# EAGLE schematic beads_v51 (EAGLE 9.0.1)

## Sheet 1 of 8
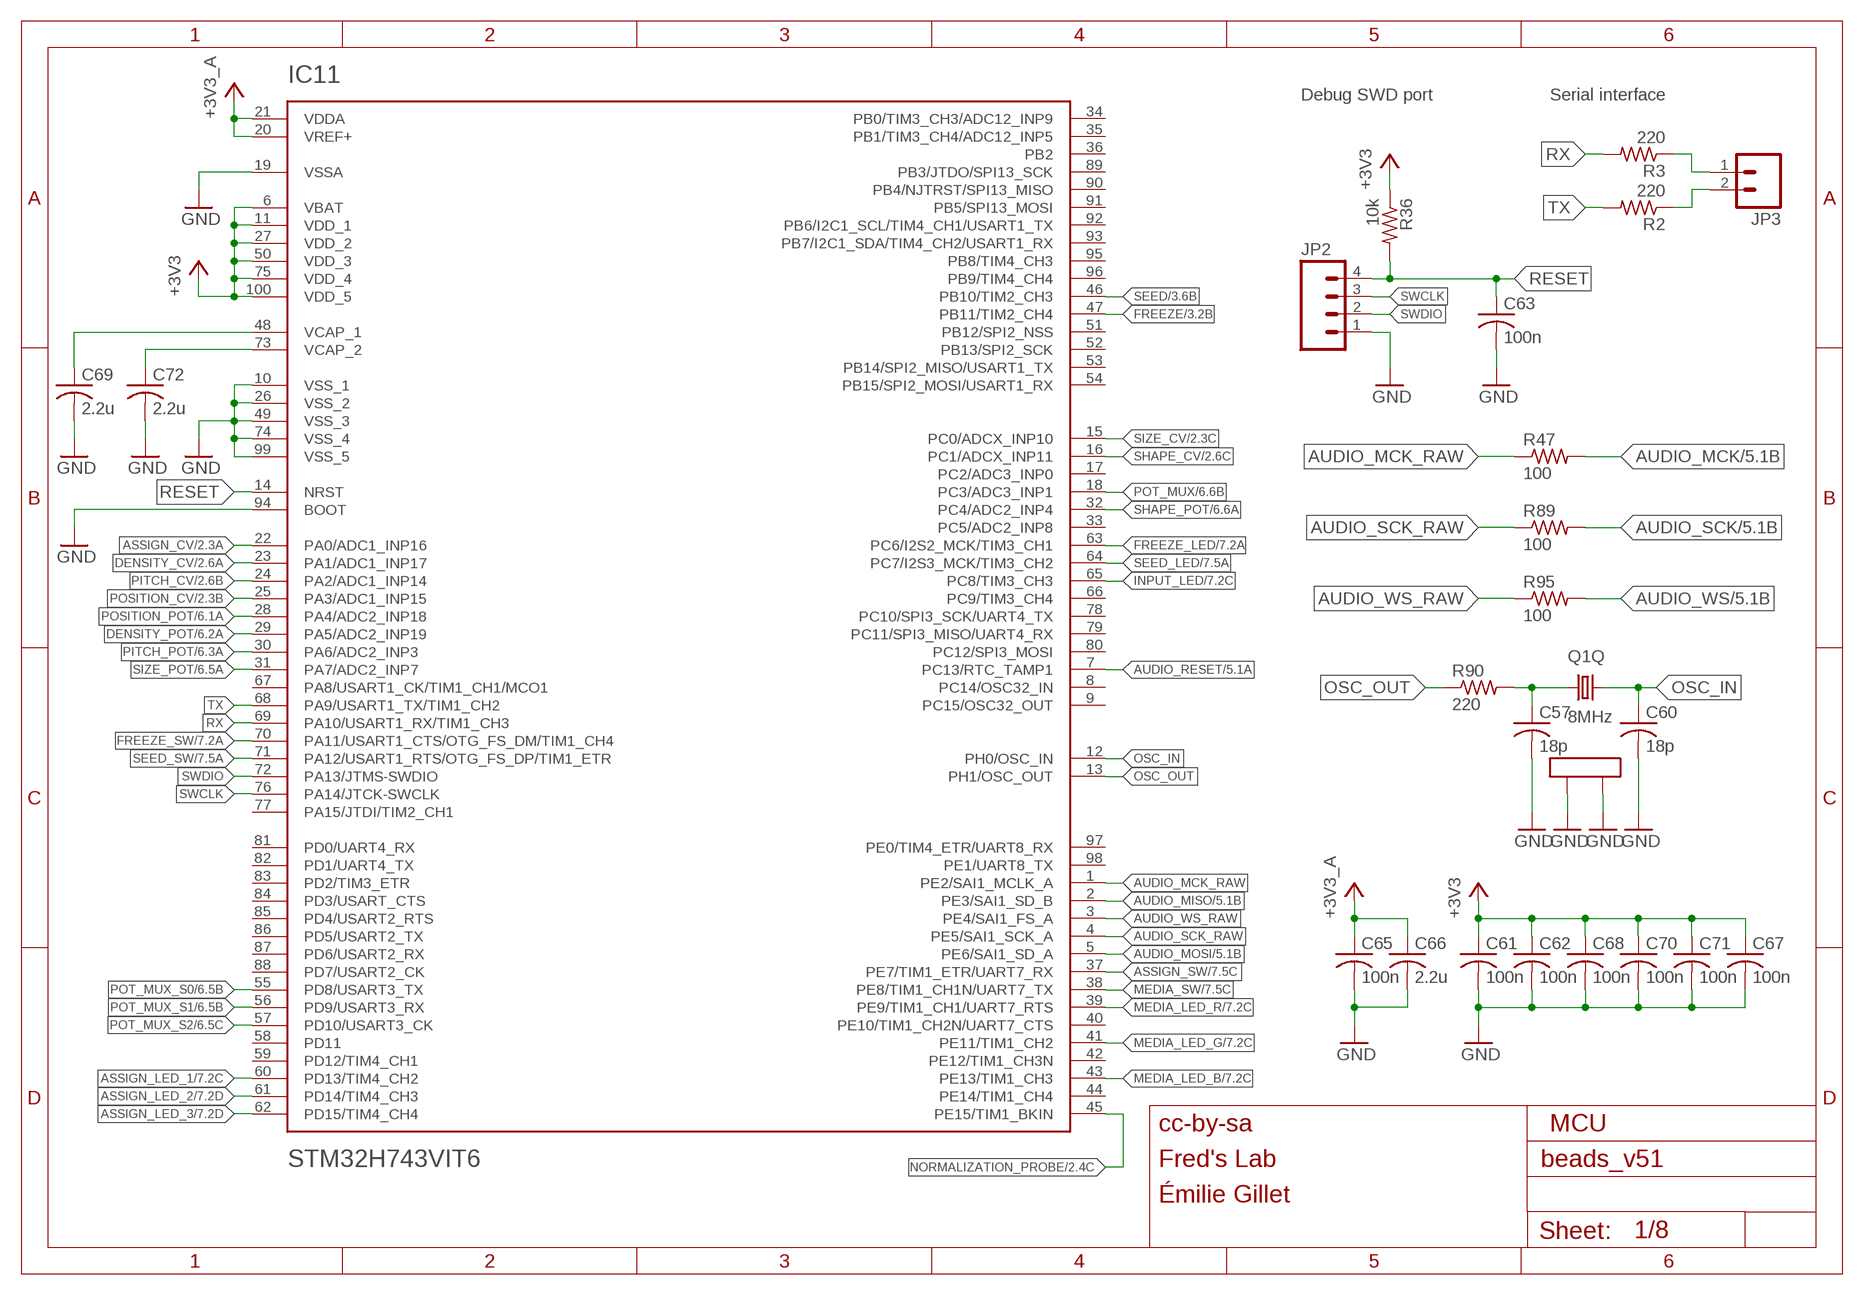
[diagram p0: schematic, sheet 1]

### Parts
C57  18p  C-USC0402  [C0402]
C60  18p  C-USC0402  [C0402]
C61  100n  C-USC0402  [C0402]
C62  100n  C-USC0402  [C0402]
C63  100n  C-USC0402  [C0402]
C65  100n  C-USC0402  [C0402]
C66  2.2u  C-USC0402  [C0402]
C67  100n  C-USC0402  [C0402]
C68  100n  C-USC0402  [C0402]
C69  2.2u  C-USC0402  [C0402]
C70  100n  C-USC0402  [C0402]
C71  100n  C-USC0402  [C0402]
C72  2.2u  C-USC0402  [C0402]
IC11  STM32H743VIT6  STM32H74X  [TQFP100]
JP2  M04PTH  [1X04]
JP3  M02PTH  [1X02]
Q1  8MHz  CRYSTAL  [CTS406]
R2  220  R-US_R0402  [R0402]
R3  220  R-US_R0402  [R0402]
R36  10k  R-US_R0402  [R0402]
R47  100  R-US_R0402  [R0402]
R89  100  R-US_R0402  [R0402]
R90  220  R-US_R0402  [R0402]
R95  100  R-US_R0402  [R0402]

### Nets
+3V3: C61.1 C62.1 C67.1 C68.1 C70.1 C71.1 IC11.6(VBAT) IC11.11(VDD_1) IC11.27(VDD_2) IC11.50(VDD_3) IC11.75(VDD_4) IC11.100(VDD_5) R36.1 ; also sheet 2,7,8
+3V3_A: C65.1 C66.1 IC11.20(VREF+) IC11.21(VDDA) ; also sheet 2,3,5,6,8
ASSIGN_CV: IC11.22(PA0/ADC1_INP16) ; also sheet 2
ASSIGN_LED_1: IC11.60(PD13/TIM4_CH2) ; also sheet 7
ASSIGN_LED_2: IC11.61(PD14/TIM4_CH3) ; also sheet 7
ASSIGN_LED_3: IC11.62(PD15/TIM4_CH4) ; also sheet 7
ASSIGN_SW: IC11.37(PE7/TIM1_ETR/UART7_RX) ; also sheet 7
AUDIO_MCK: R47.2 ; also sheet 5
AUDIO_MCK_RAW: IC11.1(PE2/SAI1_MCLK_A) R47.1
AUDIO_MISO: IC11.2(PE3/SAI1_SD_B) ; also sheet 5
AUDIO_MOSI: IC11.5(PE6/SAI1_SD_A) ; also sheet 5
AUDIO_RESET: IC11.7(PC13/RTC_TAMP1) ; also sheet 5
AUDIO_SCK: R89.2 ; also sheet 5
AUDIO_SCK_RAW: IC11.4(PE5/SAI1_SCK_A) R89.1
AUDIO_WS: R95.2 ; also sheet 5
AUDIO_WS_RAW: IC11.3(PE4/SAI1_FS_A) R95.1
DENSITY_CV: IC11.23(PA1/ADC1_INP17) ; also sheet 2
DENSITY_POT: IC11.29(PA5/ADC2_INP19) ; also sheet 6
FREEZE: IC11.47(PB11/TIM2_CH4) ; also sheet 3
FREEZE_LED: IC11.63(PC6/I2S2_MCK/TIM3_CH1) ; also sheet 7
FREEZE_SW: IC11.70(PA11/USART1_CTS/OTG_FS_DM/TIM1_CH4) ; also sheet 7
GND: C57.2 C60.2 C61.2 C62.2 C63.2 C65.2 C66.2 C67.2 C68.2 C69.2 C70.2 C71.2 C72.2 IC11.10(VSS_1) IC11.19(VSSA) IC11.26(VSS_2) IC11.49(VSS_3) IC11.74(VSS_4) IC11.94(BOOT) IC11.99(VSS_5) JP2.1 Q1.2(LID1) Q1.4(LID2) ; also sheet 2,3,4,5,6,7,8
INPUT_LED: IC11.65(PC8/TIM3_CH3) ; also sheet 7
MEDIA_LED_B: IC11.43(PE13/TIM1_CH3) ; also sheet 7
MEDIA_LED_G: IC11.41(PE11/TIM1_CH2) ; also sheet 7
MEDIA_LED_R: IC11.39(PE9/TIM1_CH1/UART7_RTS) ; also sheet 7
MEDIA_SW: IC11.38(PE8/TIM1_CH1N/UART7_TX) ; also sheet 7
N$4: C57.1 Q1.1 R90.2
N$5: JP3.2 R2.1
N$6: JP3.1 R3.1
NORMALIZATION_PROBE: IC11.45(PE15/TIM1_BKIN) ; also sheet 2,3,4
OSC_IN: C60.1 IC11.12(PH0/OSC_IN) Q1.3
OSC_OUT: IC11.13(PH1/OSC_OUT) R90.1
PITCH_CV: IC11.24(PA2/ADC1_INP14) ; also sheet 2
PITCH_POT: IC11.30(PA6/ADC2_INP3) ; also sheet 6
POSITION_CV: IC11.25(PA3/ADC1_INP15) ; also sheet 2
POSITION_POT: IC11.28(PA4/ADC2_INP18) ; also sheet 6
POT_MUX: IC11.18(PC3/ADC3_INP1) ; also sheet 6
POT_MUX_S0: IC11.55(PD8/USART3_TX) ; also sheet 6
POT_MUX_S1: IC11.56(PD9/USART3_RX) ; also sheet 6
POT_MUX_S2: IC11.57(PD10/USART3_CK) ; also sheet 6
RESET: C63.1 IC11.14(NRST) JP2.4 R36.2
RX: IC11.69(PA10/USART1_RX/TIM1_CH3) R3.2
SEED: IC11.46(PB10/TIM2_CH3) ; also sheet 3
SEED_LED: IC11.64(PC7/I2S3_MCK/TIM3_CH2) ; also sheet 7
SEED_SW: IC11.71(PA12/USART1_RTS/OTG_FS_DP/TIM1_ETR) ; also sheet 7
SHAPE_CV: IC11.16(PC1/ADCX_INP11) ; also sheet 2
SHAPE_POT: IC11.32(PC4/ADC2_INP4) ; also sheet 6
SIZE_CV: IC11.15(PC0/ADCX_INP10) ; also sheet 2
SIZE_POT: IC11.31(PA7/ADC2_INP7) ; also sheet 6
SWCLK: IC11.76(PA14/JTCK-SWCLK) JP2.3
SWDIO: IC11.72(PA13/JTMS-SWDIO) JP2.2
TX: IC11.68(PA9/USART1_TX/TIM1_CH2) R2.2
VCAP_1: C69.1 IC11.48(VCAP_1)
VCAP_2: C72.1 IC11.73(VCAP_2)
Unconnected: IC11.8(PC14/OSC32_IN) IC11.9(PC15/OSC32_OUT) IC11.17(PC2/ADC3_INP0) IC11.33(PC5/ADC2_INP8) IC11.34(PB0/TIM3_CH3/ADC12_INP9) IC11.35(PB1/TIM3_CH4/ADC12_INP5) IC11.36(PB2) IC11.40(PE10/TIM1_CH2N/UART7_CTS) IC11.42(PE12/TIM1_CH3N) IC11.44(PE14/TIM1_CH4) IC11.51(PB12/SPI2_NSS) IC11.52(PB13/SPI2_SCK) IC11.53(PB14/SPI2_MISO/USART1_TX) IC11.54(PB15/SPI2_MOSI/USART1_RX) IC11.58(PD11) IC11.59(PD12/TIM4_CH1) IC11.66(PC9/TIM3_CH4) IC11.67(PA8/USART1_CK/TIM1_CH1/MCO1) IC11.77(PA15/JTDI/TIM2_CH1) IC11.78(PC10/SPI3_SCK/UART4_TX) IC11.79(PC11/SPI3_MISO/UART4_RX) IC11.80(PC12/SPI3_MOSI) IC11.81(PD0/UART4_RX) IC11.82(PD1/UART4_TX) IC11.83(PD2/TIM3_ETR) IC11.84(PD3/USART_CTS) IC11.85(PD4/USART2_RTS) IC11.86(PD5/USART2_TX) IC11.87(PD6/USART2_RX) IC11.88(PD7/USART2_CK) IC11.89(PB3/JTDO/SPI13_SCK) IC11.90(PB4/NJTRST/SPI13_MISO) IC11.91(PB5/SPI13_MOSI) IC11.92(PB6/I2C1_SCL/TIM4_CH1/USART1_TX) IC11.93(PB7/I2C1_SDA/TIM4_CH2/USART1_RX) IC11.95(PB8/TIM4_CH3) IC11.96(PB9/TIM4_CH4) IC11.97(PE0/TIM4_ETR/UART8_RX) IC11.98(PE1/UART8_TX)

### Notes on the sheet
- Debug SWD port | Serial interface
- cc-by-sa | MCU
- Fred's Lab
- Émilie Gillet

## Sheet 2 of 8
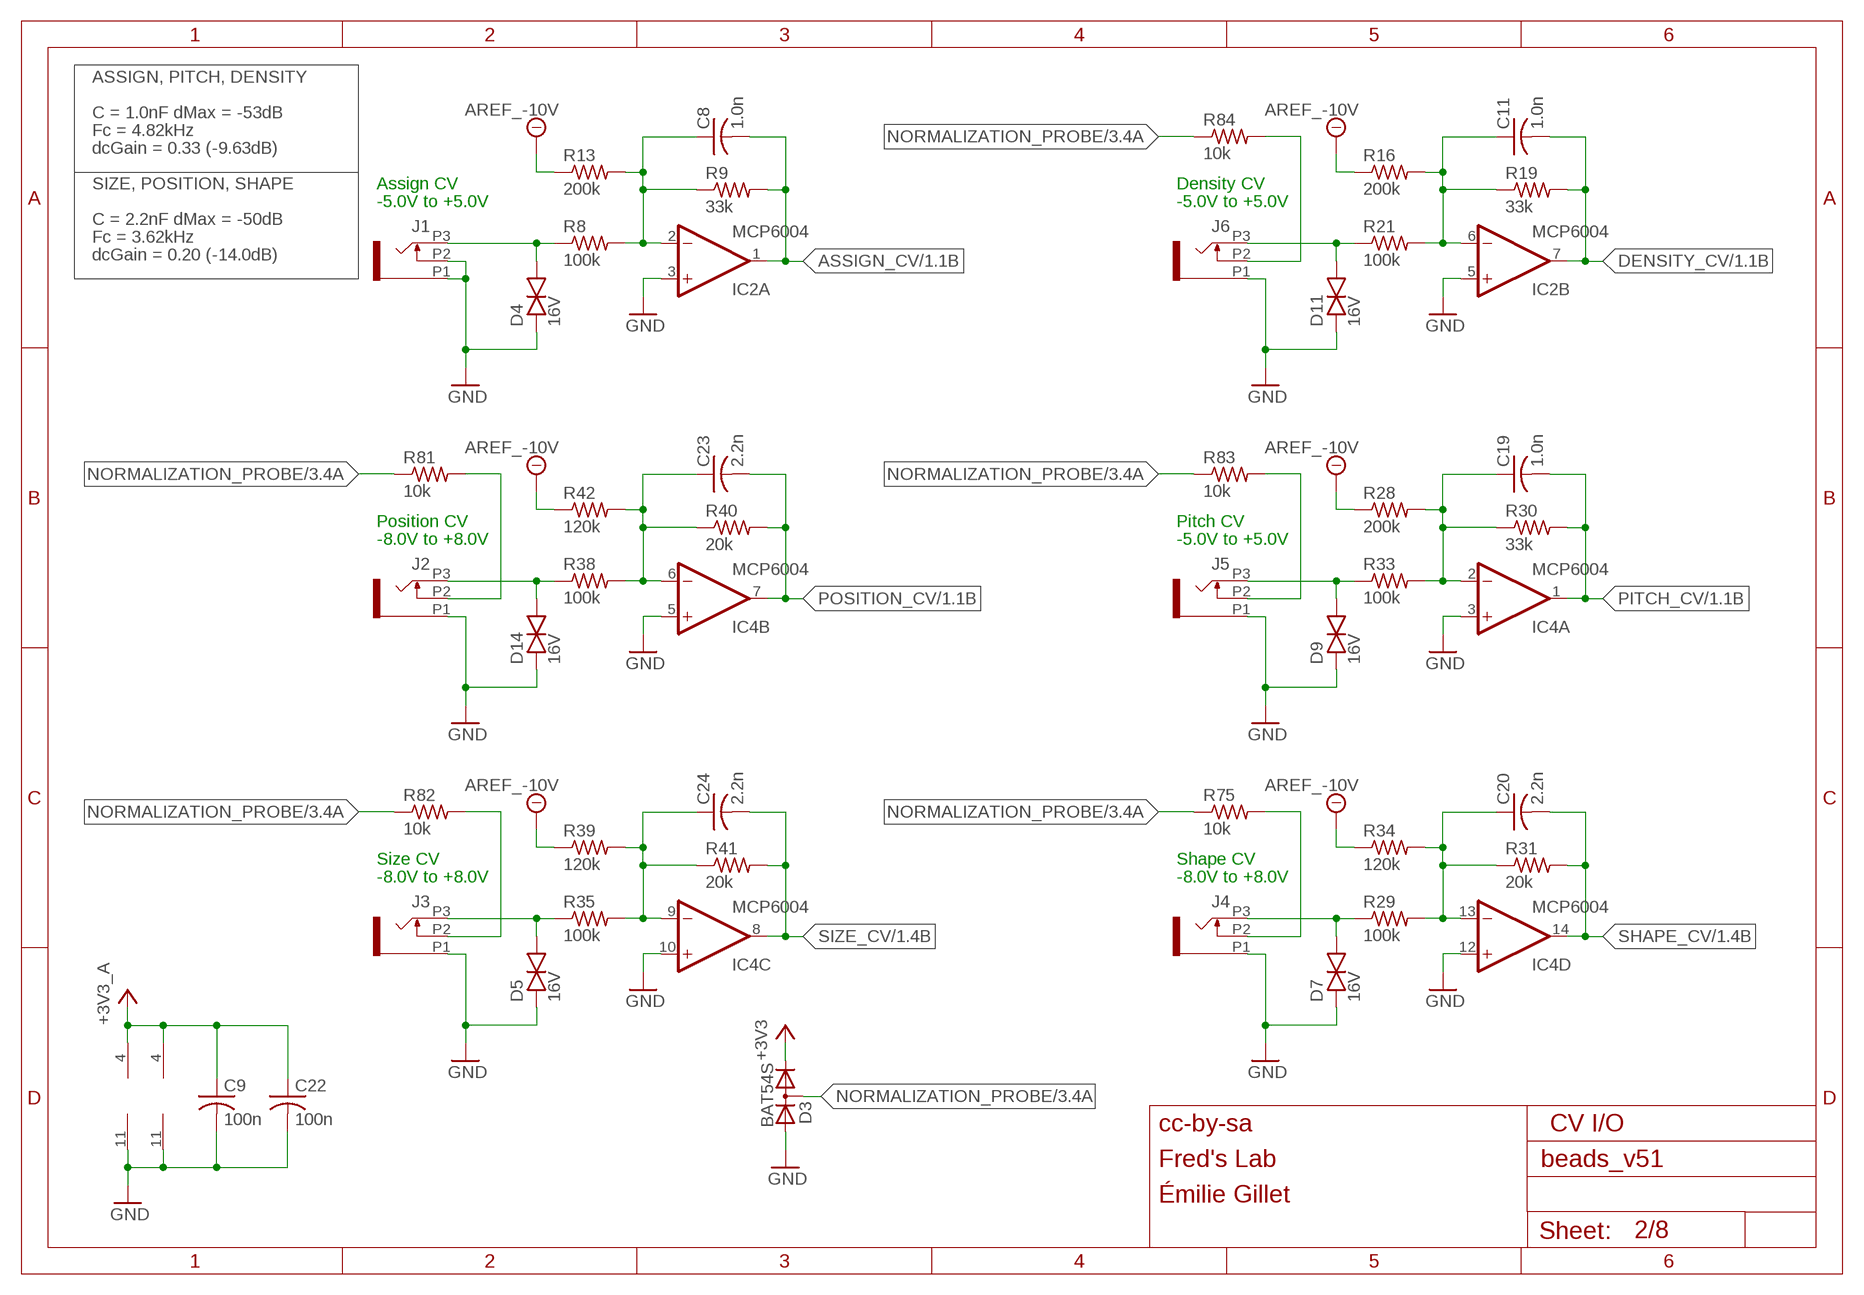
[diagram p1: schematic, sheet 2]

### Parts
C8  1.0n  C-USC0402  [C0402]
C9  100n  C-USC0402  [C0402]
C11  1.0n  C-USC0402  [C0402]
C19  1.0n  C-USC0402  [C0402]
C20  2.2n  C-USC0402  [C0402]
C22  100n  C-USC0402  [C0402]
C23  2.2n  C-USC0402  [C0402]
C24  2.2n  C-USC0402  [C0402]
D3  BAT54S  DIODE_2CACA-SOT23  [SOT23]
D4  16V  TVS  [0603]
D5  16V  TVS  [0603]
D7  16V  TVS  [0603]
D9  16V  TVS  [0603]
D11  16V  TVS  [0603]
D14  16V  TVS  [0603]
IC2  MCP6004  TL074PW  [TSSOP14_065]
IC4  MCP6004  TL074PW  [TSSOP14_065]
J1  PJ301_THONKICONNTME  [WQP_PJ_301M_TME]
J2  PJ301_THONKICONNTME  [WQP_PJ_301M_TME]
J3  PJ301_THONKICONNTME  [WQP_PJ_301M_TME]
J4  PJ301_THONKICONNTME  [WQP_PJ_301M_TME]
J5  PJ301_THONKICONNTME  [WQP_PJ_301M_TME]
J6  PJ301_THONKICONNTME  [WQP_PJ_301M_TME]
R8  100k  R-US_R0402  [R0402]
R9  33k  R-US_R0402  [R0402]
R13  200k  R-US_R0402  [R0402]
R16  200k  R-US_R0402  [R0402]
R19  33k  R-US_R0402  [R0402]
R21  100k  R-US_R0402  [R0402]
R28  200k  R-US_R0402  [R0402]
R29  100k  R-US_R0402  [R0402]
R30  33k  R-US_R0402  [R0402]
R31  20k  R-US_R0402  [R0402]
R33  100k  R-US_R0402  [R0402]
R34  120k  R-US_R0402  [R0402]
R35  100k  R-US_R0402  [R0402]
R38  100k  R-US_R0402  [R0402]
R39  120k  R-US_R0402  [R0402]
R40  20k  R-US_R0402  [R0402]
R41  20k  R-US_R0402  [R0402]
R42  120k  R-US_R0402  [R0402]
R75  10k  R-US_R0402  [R0402]
R81  10k  R-US_R0402  [R0402]
R82  10k  R-US_R0402  [R0402]
R83  10k  R-US_R0402  [R0402]
R84  10k  R-US_R0402  [R0402]

### Nets
+3V3: D3.2(C) ; also sheet 1,7,8
+3V3_A: C9.1 C22.1 IC2.4(P:V+) IC4.4(P:V+) ; also sheet 1,3,5,6,8
-10V: R13.1 R16.1 R28.1 R34.1 R39.1 R42.1 ; supply symbol labelled AREF_-10V ; also sheet 8
ASSIGN_CV: C8.2 IC2.1(A:OUT) R9.2 ; also sheet 1
DENSITY_CV: C11.2 IC2.7(B:OUT) R19.2 ; also sheet 1
GND: C9.2 C22.2 D3.1(A) D4.1(A) D5.1(A) D7.1(A) D9.1(A) D11.1(A) D14.1(A) IC2.3(A:+IN) IC2.5(B:+IN) IC2.11(P:V-) IC4.3(A:+IN) IC4.5(B:+IN) IC4.10(C:+IN) IC4.11(P:V-) IC4.12(D:+IN) J1.P1 J1.P2 J2.P1 J3.P1 J4.P1 J5.P1 J6.P1 ; also sheet 1,3,4,5,6,7,8
N$7: C8.1 IC2.2(A:-IN) R8.2 R9.1 R13.2
N$8: D4.2(C) J1.P3 R8.1
N$9: J5.P2 R83.2
N$10: C19.1 IC4.2(A:-IN) R28.2 R30.1 R33.2
N$11: D9.2(C) J5.P3 R33.1
N$13: C24.1 IC4.9(C:-IN) R35.2 R39.2 R41.1
N$14: D5.2(C) J3.P3 R35.1
N$15: J3.P2 R82.2
N$16: C11.1 IC2.6(B:-IN) R16.2 R19.1 R21.2
N$17: D11.2(C) J6.P3 R21.1
N$18: C23.1 IC4.6(B:-IN) R38.2 R40.1 R42.2
N$19: D14.2(C) J2.P3 R38.1
N$20: J2.P2 R81.2
N$21: C20.1 IC4.13(D:-IN) R29.2 R31.1 R34.2
N$22: D7.2(C) J4.P3 R29.1
N$23: J4.P2 R75.2
N$54: J6.P2 R84.2
NORMALIZATION_PROBE: D3.3(AC) R75.1 R81.1 R82.1 R83.1 R84.1 ; also sheet 1,3,4
PITCH_CV: C19.2 IC4.1(A:OUT) R30.2 ; also sheet 1
POSITION_CV: C23.2 IC4.7(B:OUT) R40.2 ; also sheet 1
SHAPE_CV: C20.2 IC4.14(D:OUT) R31.2 ; also sheet 1
SIZE_CV: C24.2 IC4.8(C:OUT) R41.2 ; also sheet 1

### Notes on the sheet
- ASSIGN, PITCH, DENSITY
- C = 1.0nF dMax = -53dB
- Fc = 4.82kHz
- dcGain = 0.33 (-9.63dB)
- SIZE, POSITION, SHAPE | Assign CV | Density CV
- -5.0V to +5.0V | -5.0V to +5.0V
- C = 2.2nF dMax = -50dB
- Fc = 3.62kHz
- dcGain = 0.20 (-14.0dB)
- Position CV | Pitch CV
- -8.0V to +8.0V | -5.0V to +5.0V
- Size CV | Shape CV
- -8.0V to +8.0V | -8.0V to +8.0V
- cc-by-sa | CV I/O
- Fred's Lab
- Émilie Gillet

## Sheet 3 of 8
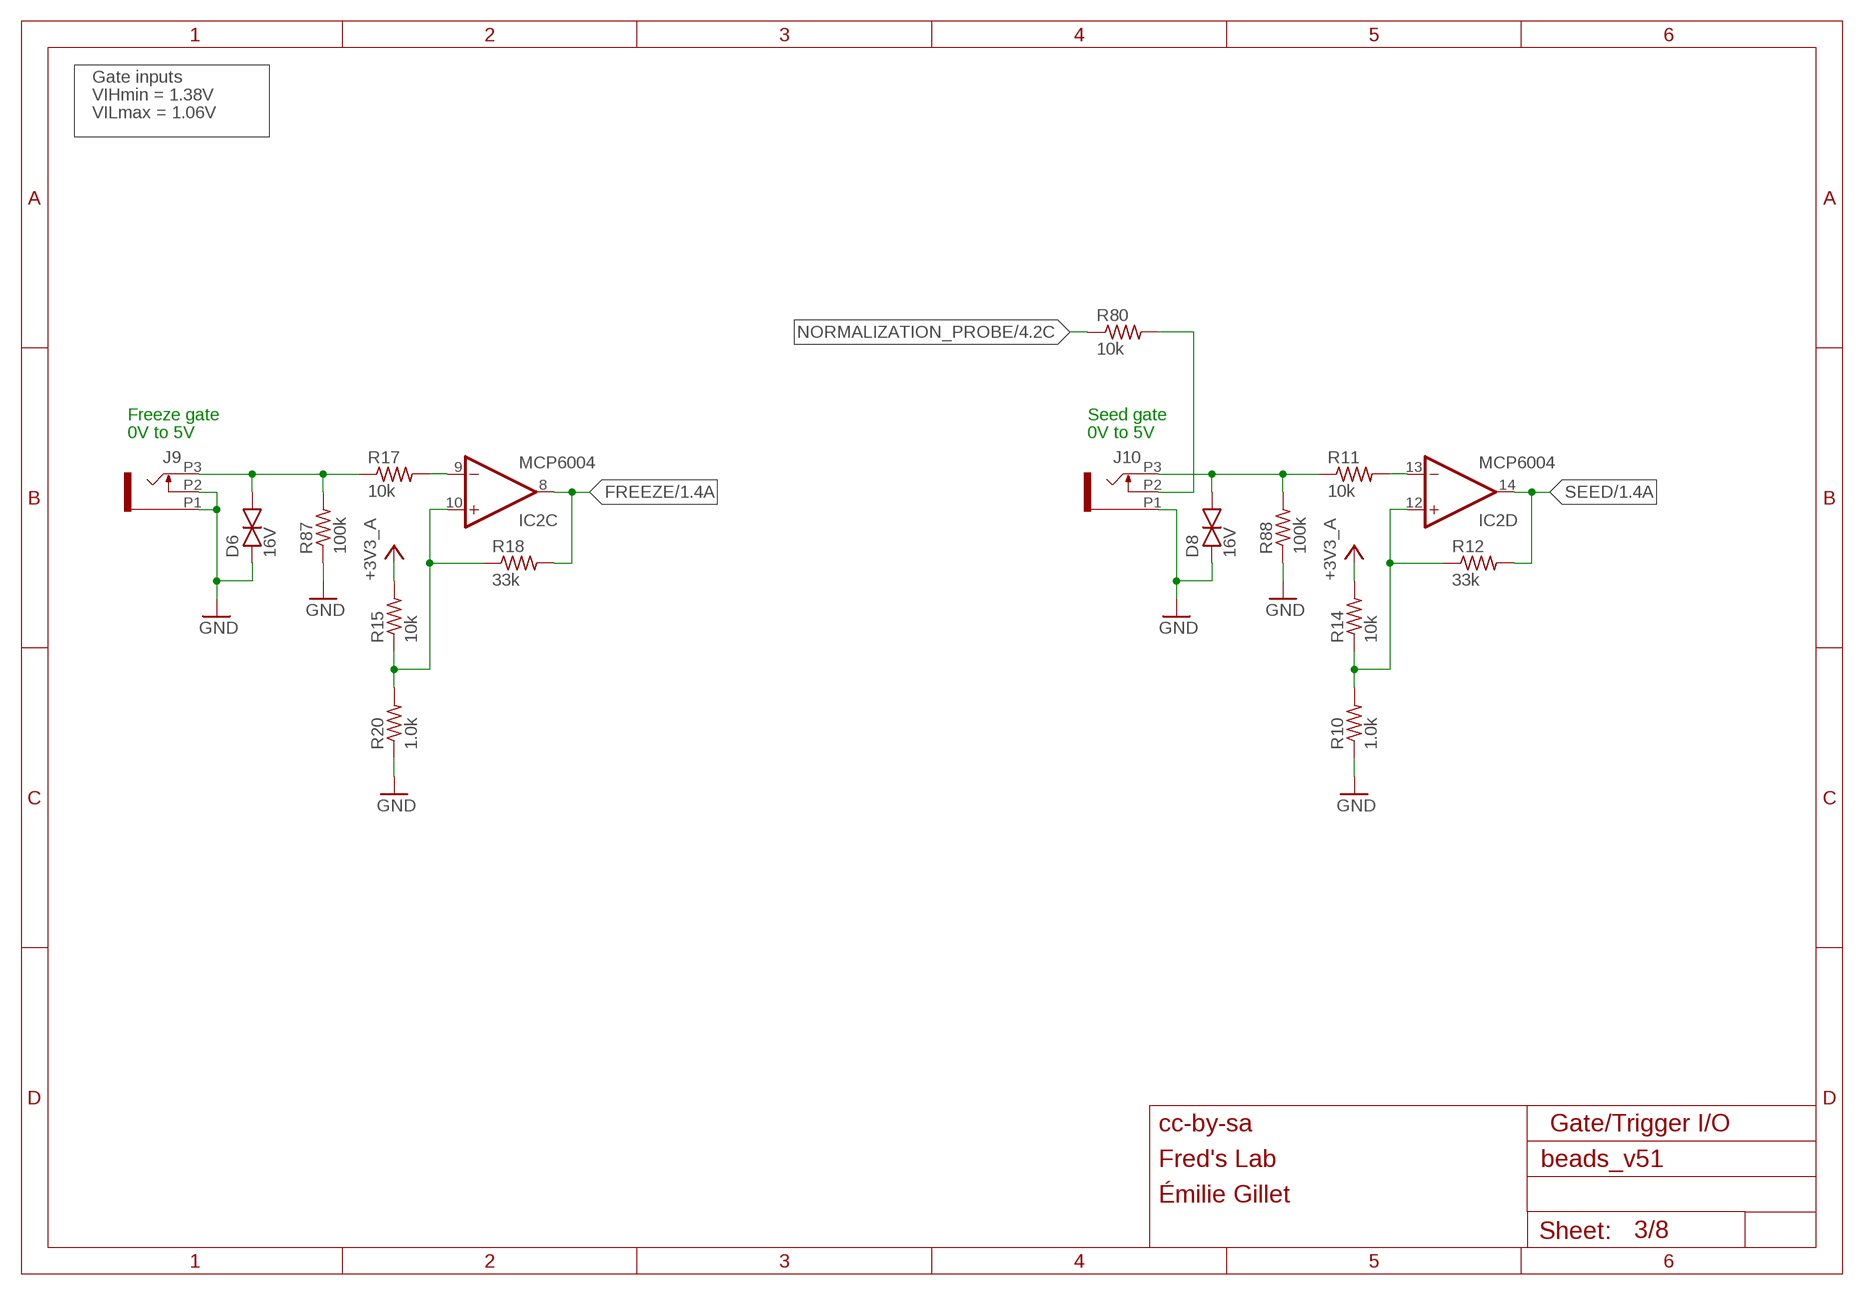
[diagram p2: schematic, sheet 3]

### Parts
D6  16V  TVS  [0603]
D8  16V  TVS  [0603]
J9  PJ301_THONKICONNTME  [WQP_PJ_301M_TME]
J10  PJ301_THONKICONNTME  [WQP_PJ_301M_TME]
R10  1.0k  R-US_R0402  [R0402]
R11  10k  R-US_R0402  [R0402]
R12  33k  R-US_R0402  [R0402]
R14  10k  R-US_R0402  [R0402]
R15  10k  R-US_R0402  [R0402]
R17  10k  R-US_R0402  [R0402]
R18  33k  R-US_R0402  [R0402]
R20  1.0k  R-US_R0402  [R0402]
R80  10k  R-US_R0402  [R0402]
R87  100k  R-US_R0402  [R0402]
R88  100k  R-US_R0402  [R0402]

### Nets
+3V3_A: R14.2 R15.2 ; also sheet 1,2,5,6,8
FREEZE: IC2.8(C:OUT) R18.2 ; also sheet 1
GND: D6.1(A) D8.1(A) J9.P1 J9.P2 J10.P1 R10.1 R20.1 R87.1 R88.1 ; also sheet 1,2,4,5,6,7,8
N$2: D6.2(C) J9.P3 R17.1 R87.2
N$24: J10.P2 R80.2
N$26: IC2.9(C:-IN) R17.2
N$27: D8.2(C) J10.P3 R11.1 R88.2
N$28: IC2.10(C:+IN) R15.1 R18.1 R20.2
N$29: IC2.13(D:-IN) R11.2
N$30: IC2.12(D:+IN) R10.2 R12.1 R14.1
NORMALIZATION_PROBE: R80.1 ; also sheet 1,2,4
SEED: IC2.14(D:OUT) R12.2 ; also sheet 1

### Notes on the sheet
- Gate inputs
- VIHmin = 1.38V
- VILmax = 1.06V
- Freeze gate | Seed gate
- 0V to 5V | 0V to 5V
- cc-by-sa | Gate/Trigger I/O
- Fred's Lab
- Émilie Gillet

## Sheet 4 of 8
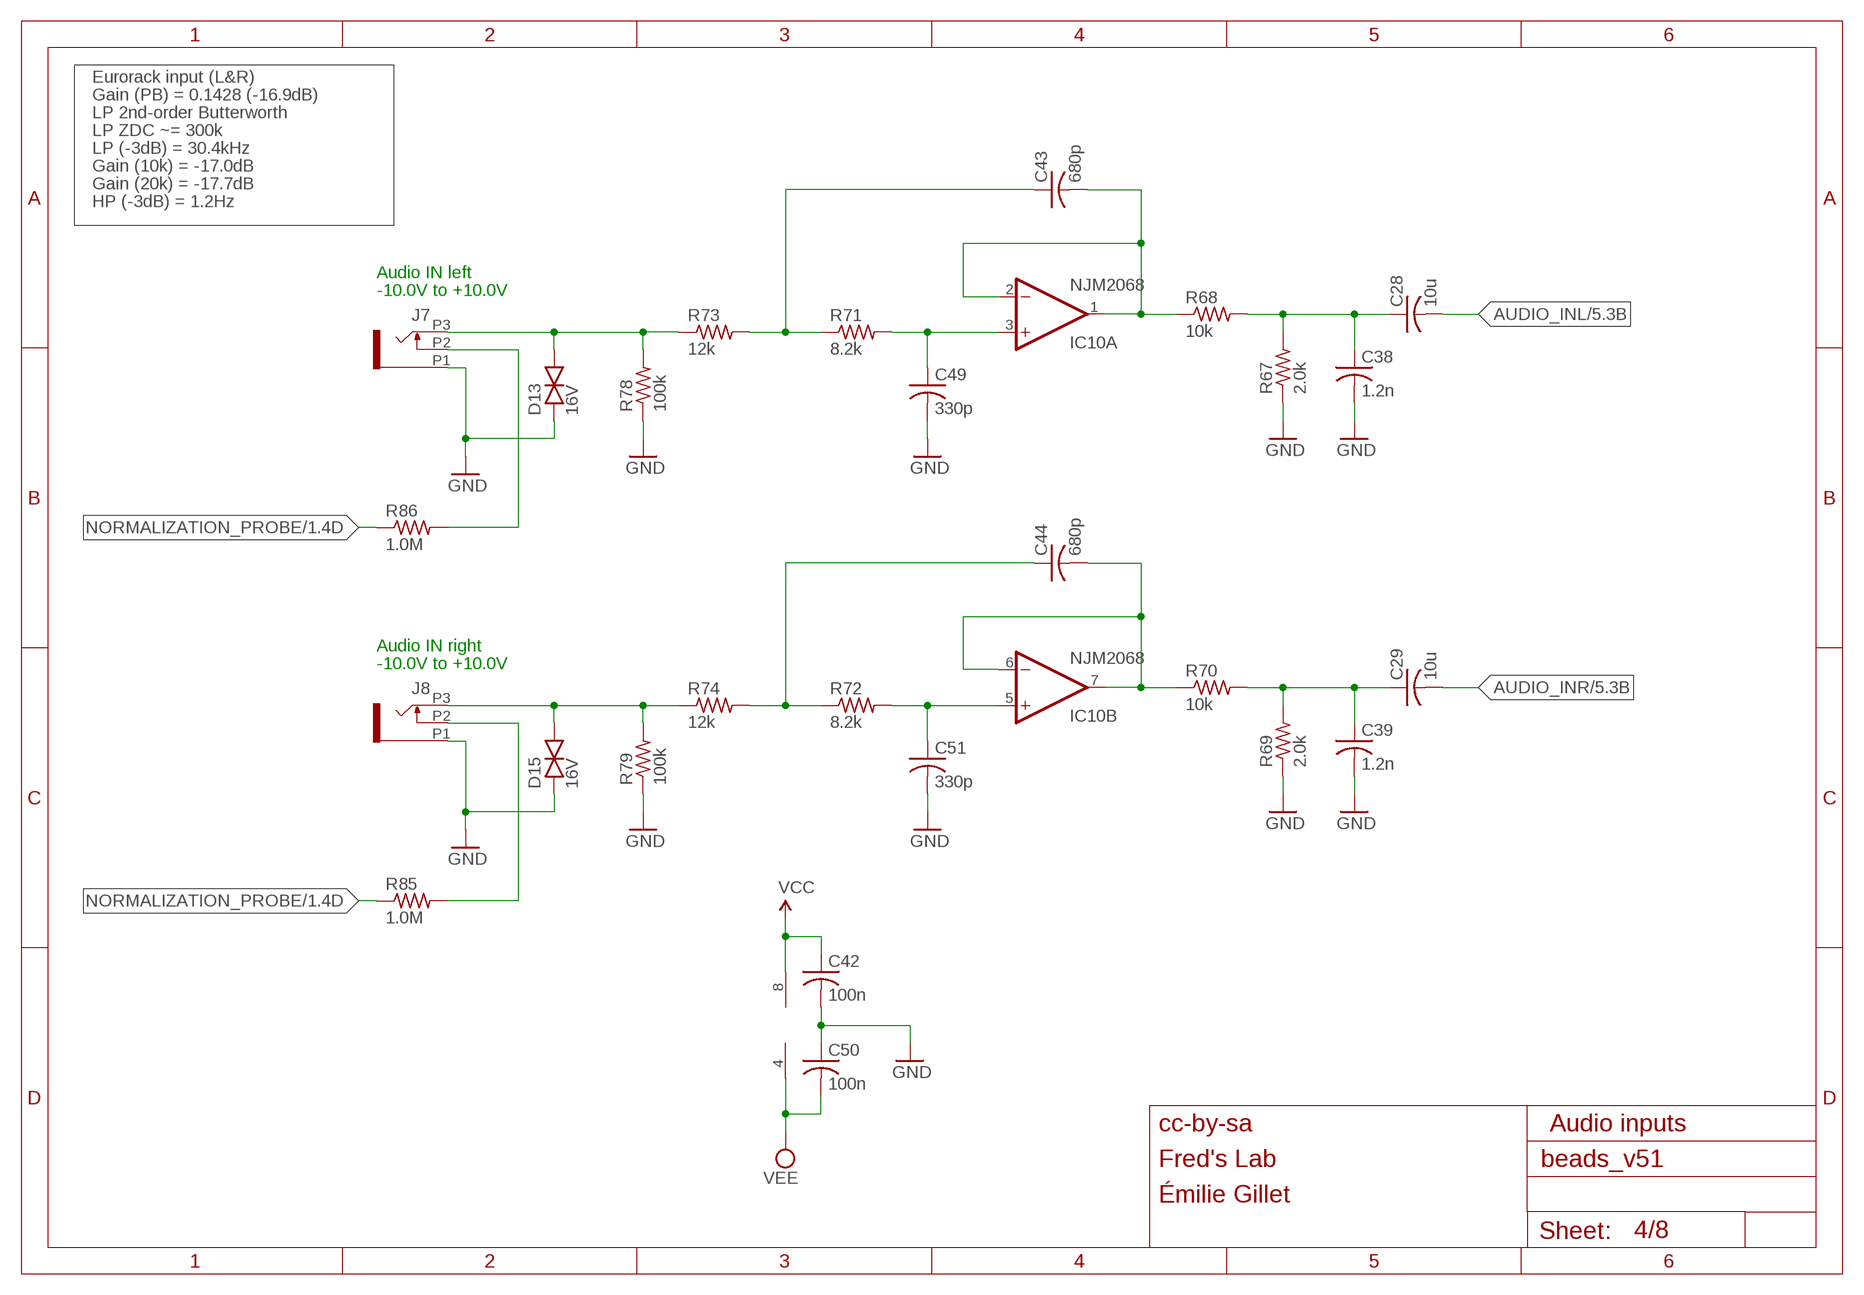
[diagram p3: schematic, sheet 4]

### Parts
C28  10u  C-USC0603  [C0603]
C29  10u  C-USC0603  [C0603]
C38  1.2n  C-USC0402  [C0402]
C39  1.2n  C-USC0402  [C0402]
C42  100n  C-USC0402  [C0402]
C43  680p  C-USC0402  [C0402]
C44  680p  C-USC0402  [C0402]
C49  330p  C-USC0402  [C0402]
C50  100n  C-USC0402  [C0402]
C51  330p  C-USC0402  [C0402]
D13  16V  TVS  [0603]
D15  16V  TVS  [0603]
IC10  NJM2068  TL072PW  [TSSOP08]
J7  PJ301_THONKICONNTME  [WQP_PJ_301M_TME]
J8  PJ301_THONKICONNTME  [WQP_PJ_301M_TME]
R67  2.0k  R-US_R0402  [R0402]
R68  10k  R-US_R0402  [R0402]
R69  2.0k  R-US_R0402  [R0402]
R70  10k  R-US_R0402  [R0402]
R71  8.2k  R-US_R0402  [R0402]
R72  8.2k  R-US_R0402  [R0402]
R73  12k  R-US_R0402  [R0402]
R74  12k  R-US_R0402  [R0402]
R78  100k  R-US_R0402  [R0402]
R79  100k  R-US_R0402  [R0402]
R85  1.0M  R-US_R0402  [R0402]
R86  1.0M  R-US_R0402  [R0402]

### Nets
AUDIO_INL: C28.2 ; also sheet 5
AUDIO_INR: C29.2 ; also sheet 5
GND: C38.2 C39.2 C42.2 C49.2 C50.1 C51.2 D13.1(A) D15.1(A) J7.P1 J8.P1 R67.1 R69.1 R78.1 R79.1 ; also sheet 1,2,3,5,6,7,8
N$25: D15.2(C) J8.P3 R74.1 R79.2
N$32: D13.2(C) J7.P3 R73.1 R78.2
N$33: C43.1 R71.1 R73.2
N$36: J7.P2 R86.2
N$37: C51.1 IC10.5(B:+IN) R72.2
N$43: C49.1 IC10.3(A:+IN) R71.2
N$44: C43.2 IC10.1(A:OUT) IC10.2(A:-IN) R68.1
N$45: J8.P2 R85.2
N$46: C44.2 IC10.6(B:-IN) IC10.7(B:OUT) R70.1
N$47: C28.1 C38.1 R67.2 R68.2
N$49: C44.1 R72.1 R74.2
N$53: C29.1 C39.1 R69.2 R70.2
NORMALIZATION_PROBE: R85.1 R86.1 ; also sheet 1,2,3
VCC: C42.1 IC10.8(P:V+) ; also sheet 5,8
VEE: C50.2 IC10.4(P:V-) ; also sheet 5,8

### Notes on the sheet
- Eurorack input (L&R)
- Gain (PB) = 0.1428 (-16.9dB)
- LP 2nd-order Butterworth
- LP ZDC ~= 300k
- LP (-3dB) = 30.4kHz
- Gain (10k) = -17.0dB
- Gain (20k) = -17.7dB
- HP (-3dB) = 1.2Hz
- Audio IN left
- -10.0V to +10.0V
- Audio IN right
- -10.0V to +10.0V
- cc-by-sa | Audio inputs
- Fred's Lab
- Émilie Gillet

## Sheet 5 of 8
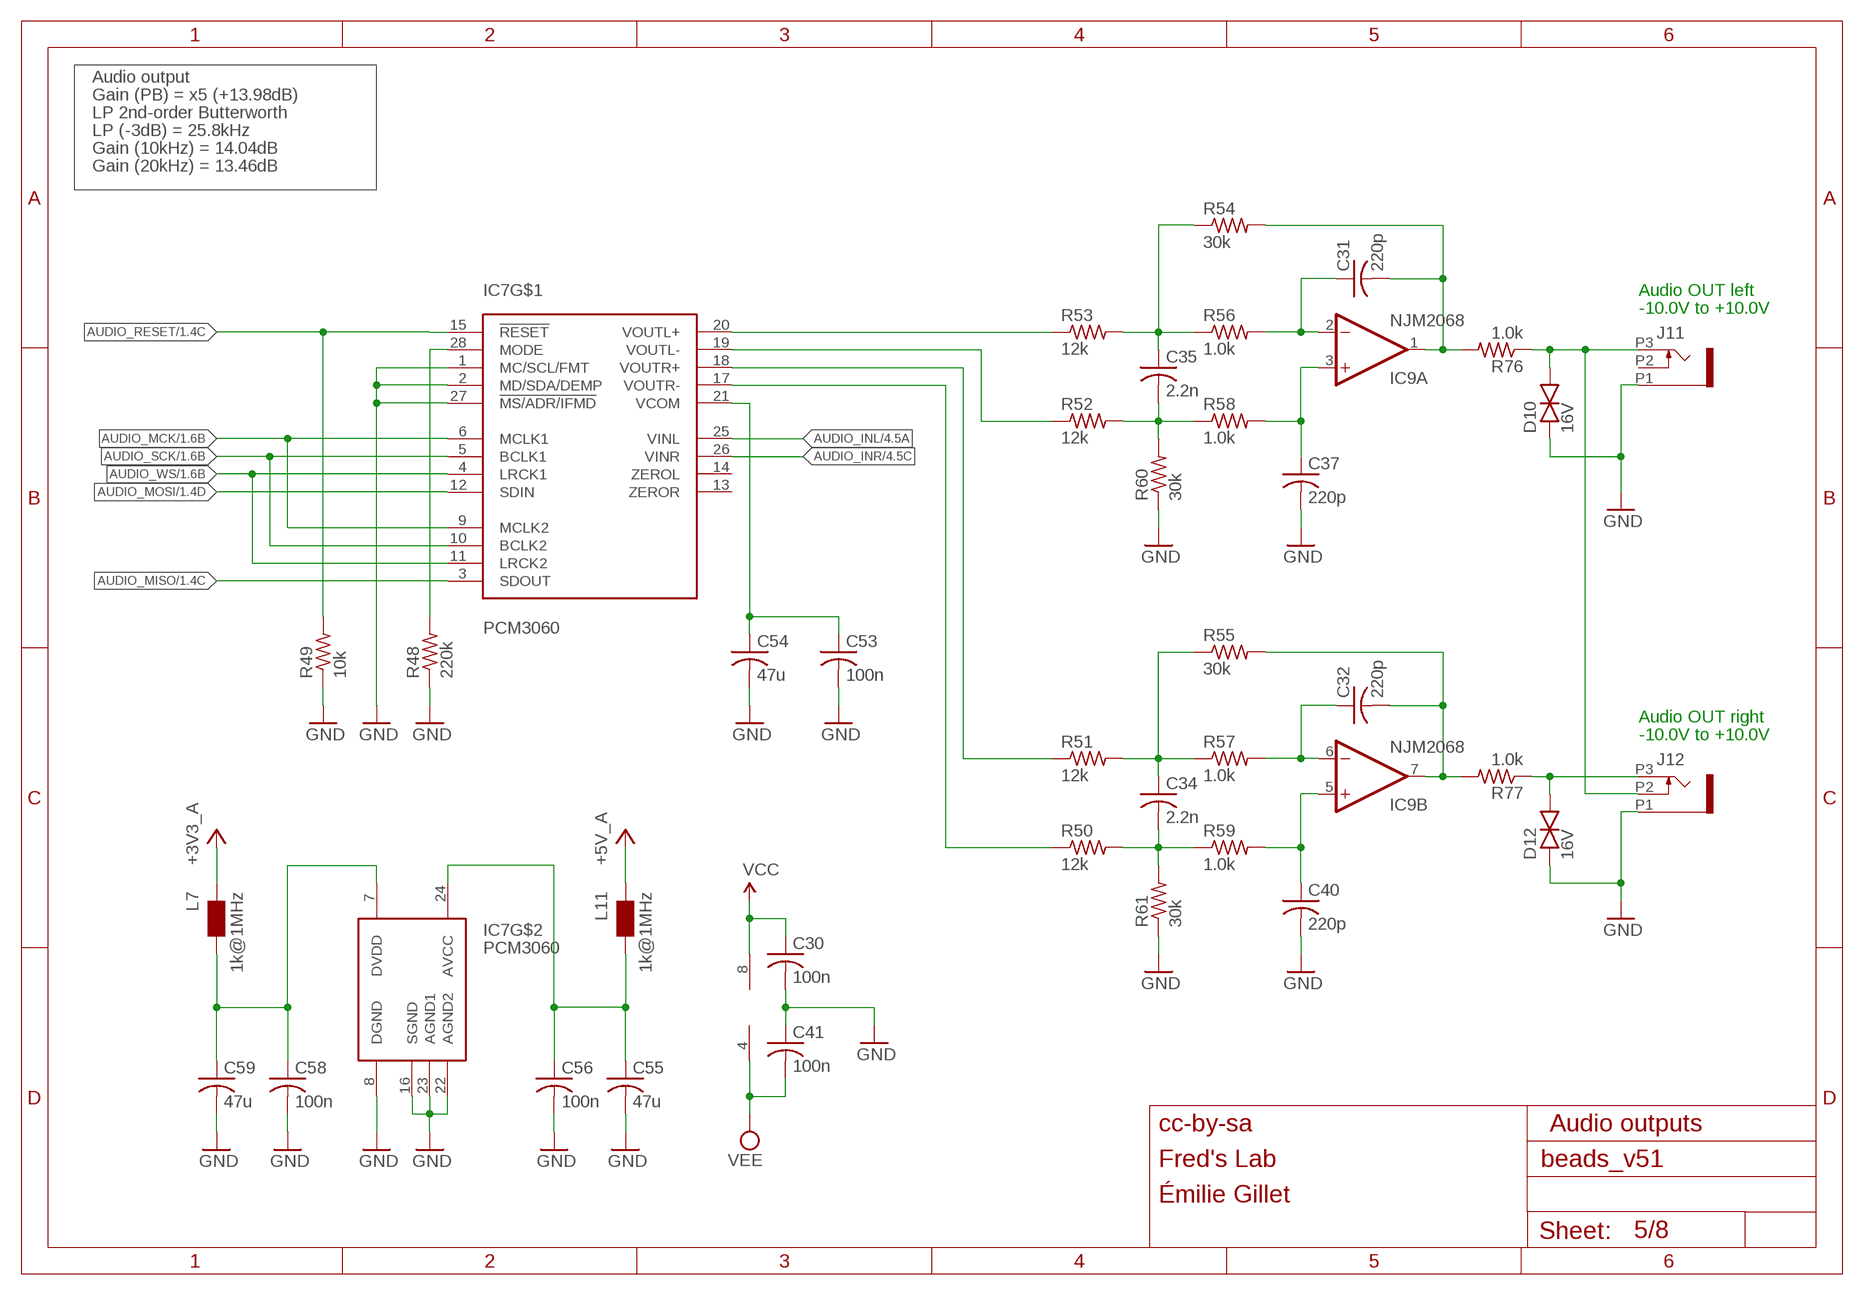
[diagram p4: schematic, sheet 5]

### Parts
C30  100n  C-USC0402  [C0402]
C31  220p  C-USC0402  [C0402]
C32  220p  C-USC0402  [C0402]
C34  2.2n  C-USC0603  [C0603]
C35  2.2n  C-USC0603  [C0603]
C37  220p  C-USC0402  [C0402]
C40  220p  C-USC0402  [C0402]
C41  100n  C-USC0402  [C0402]
C53  100n  C-USC0402  [C0402]
C54  47u  C-USC0805  [C0805]
C55  47u  C-USC0805  [C0805]
C56  100n  C-USC0402  [C0402]
C58  100n  C-USC0402  [C0402]
C59  47u  C-USC0805  [C0805]
D10  16V  TVS  [0603]
D12  16V  TVS  [0603]
IC7  PCM3060  [TSSOP28]
IC9  NJM2068  TL072PW  [TSSOP08]
J11  PJ301_THONKICONNTME  [WQP_PJ_301M_TME]
J12  PJ301_THONKICONNTME  [WQP_PJ_301M_TME]
L7  1k@1MHz  WE-CBF_0603  [0603]
L11  1k@1MHz  WE-CBF_0603  [0603]
R48  220k  R-US_R0402  [R0402]
R49  10k  R-US_R0402  [R0402]
R50  12k  R-US_R0402  [R0402]
R51  12k  R-US_R0402  [R0402]
R52  12k  R-US_R0402  [R0402]
R53  12k  R-US_R0402  [R0402]
R54  30k  R-US_R0402  [R0402]
R55  30k  R-US_R0402  [R0402]
R56  1.0k  R-US_R0402  [R0402]
R57  1.0k  R-US_R0402  [R0402]
R58  1.0k  R-US_R0402  [R0402]
R59  1.0k  R-US_R0402  [R0402]
R60  30k  R-US_R0402  [R0402]
R61  30k  R-US_R0402  [R0402]
R76  1.0k  R-US_R0603  [R0603]
R77  1.0k  R-US_R0603  [R0603]

### Nets
+3V3_A: L7.1 ; also sheet 1,2,3,6,8
+5V_A: L11.1 ; also sheet 8
AUDIO_INL: IC7.25(VINL) ; also sheet 4
AUDIO_INR: IC7.26(VINR) ; also sheet 4
AUDIO_MCK: IC7.6(MCLK1) IC7.9(MCLK2) ; also sheet 1
AUDIO_MISO: IC7.3(SDOUT) ; also sheet 1
AUDIO_MOSI: IC7.12(SDIN) ; also sheet 1
AUDIO_RESET: IC7.15(!RESET) R49.2 ; also sheet 1
AUDIO_SCK: IC7.5(BCLK1) IC7.10(BCLK2) ; also sheet 1
AUDIO_WS: IC7.4(LRCK1) IC7.11(LRCK2) ; also sheet 1
GND: C30.2 C37.2 C40.2 C41.1 C53.2 C54.2 C55.2 C56.2 C58.2 C59.2 D10.1(A) D12.1(A) IC7.1(MC/SCL/FMT) IC7.2(MD/SDA/DEMP) IC7.8(DGND) IC7.16(SGND) IC7.22(AGND2) IC7.23(AGND1) IC7.27(!MS/ADR/IFMD) J11.P1 J12.P1 R48.1 R49.1 R60.1 R61.1 ; also sheet 1,2,3,4,6,7,8
N$3: C40.1 IC9.5(B:+IN) R59.2
N$35: C35.2 R52.2 R58.1 R60.2
N$39: C35.1 R53.2 R54.1 R56.1
N$41: C34.1 R51.2 R55.1 R57.1
N$51: C55.1 C56.1 IC7.24(AVCC) L11.2
N$52: D12.2(C) J12.P3 R77.1
N$55: D10.2(C) J11.P3 J12.P2 R76.1
N$58: C31.1 IC9.2(A:-IN) R56.2
N$59: C31.2 IC9.1(A:OUT) R54.2 R76.2
N$60: C32.1 IC9.6(B:-IN) R57.2
N$61: C32.2 IC9.7(B:OUT) R55.2 R77.2
N$62: C37.1 IC9.3(A:+IN) R58.2
N$63: C34.2 R50.2 R59.1 R61.2
N$65: IC7.20(VOUTL+) R53.1
N$66: IC7.19(VOUTL-) R52.1
N$67: C58.1 C59.1 IC7.7(DVDD) L7.2
N$68: IC7.18(VOUTR+) R51.1
N$69: IC7.17(VOUTR-) R50.1
N$73: IC7.28(MODE) R48.2
N$82: C53.1 C54.1 IC7.21(VCOM)
VCC: C30.1 IC9.8(P:V+) ; also sheet 4,8
VEE: C41.2 IC9.4(P:V-) ; also sheet 4,8
Unconnected: IC7.13(ZEROR) IC7.14(ZEROL) J11.P2

### Notes on the sheet
- Audio output
- Gain (PB) = x5 (+13.98dB)
- LP 2nd-order Butterworth
- LP (-3dB) = 25.8kHz
- Gain (10kHz) = 14.04dB
- Gain (20kHz) = 13.46dB
- Audio OUT left
- -10.0V to +10.0V
- Audio OUT right
- -10.0V to +10.0V
- cc-by-sa | Audio outputs
- Fred's Lab
- Émilie Gillet

## Sheet 6 of 8
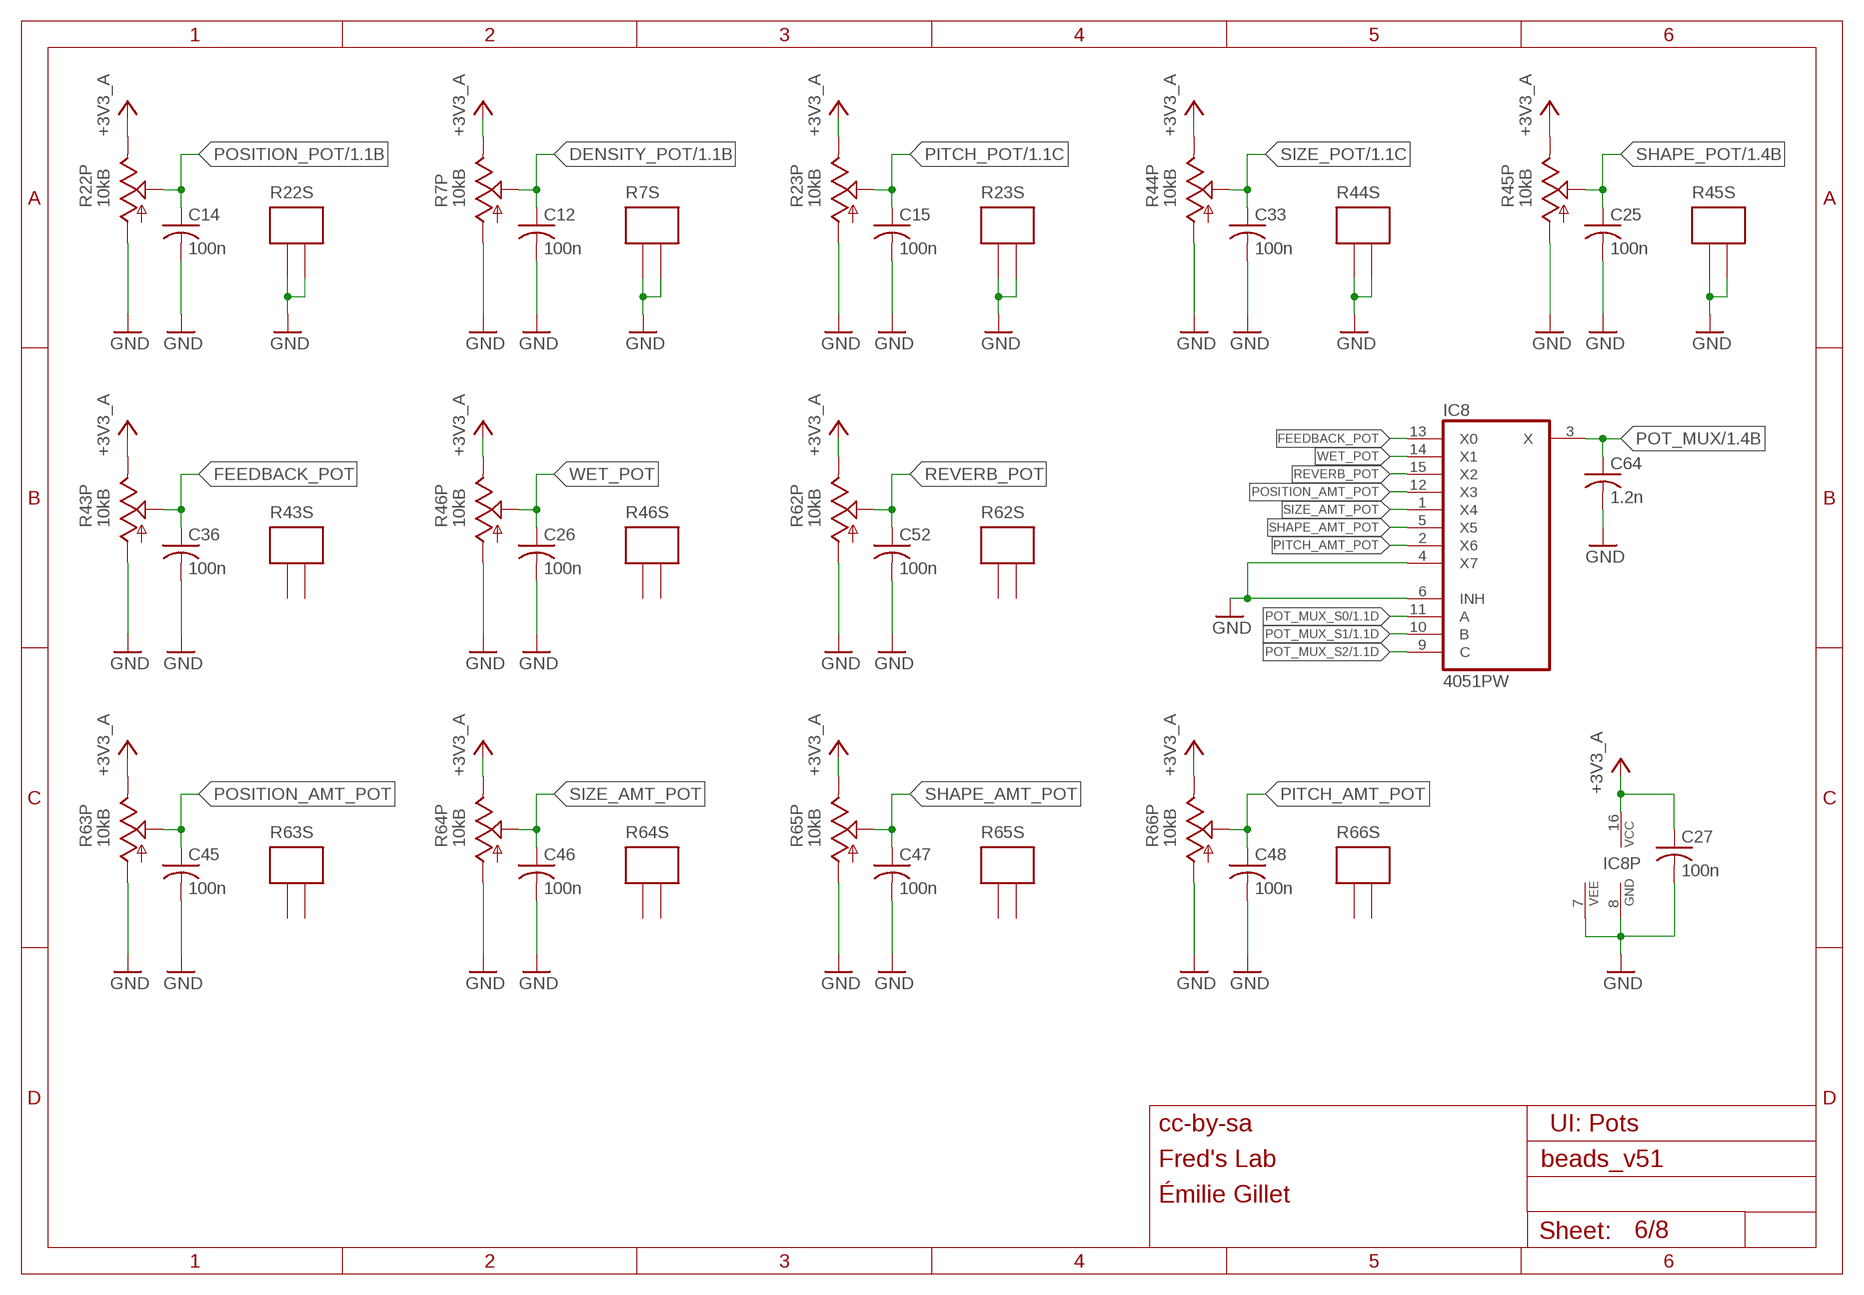
[diagram p5: schematic, sheet 6]

### Parts
C12  100n  C-USC0402  [C0402]
C14  100n  C-USC0402  [C0402]
C15  100n  C-USC0402  [C0402]
C25  100n  C-USC0402  [C0402]
C26  100n  C-USC0402  [C0402]
C27  100n  C-USC0402  [C0402]
C33  100n  C-USC0402  [C0402]
C36  100n  C-USC0402  [C0402]
C45  100n  C-USC0402  [C0402]
C46  100n  C-USC0402  [C0402]
C47  100n  C-USC0402  [C0402]
C48  100n  C-USC0402  [C0402]
C52  100n  C-USC0402  [C0402]
C64  1.2n  C-USC0402  [C0402]
IC8  4051PW  [TSSOP16_065]
R7  10kB  POT_US_SHIELDEDVERTICAL_PS  [ALPS_POT_VERTICAL_PS]
R22  10kB  POT_US_SHIELDEDVERTICAL_PS  [ALPS_POT_VERTICAL_PS]
R23  10kB  POT_US_SHIELDEDVERTICAL_PS  [ALPS_POT_VERTICAL_PS]
R43  10kB  POT_US_SHIELDEDVERTICAL_NARROW  [ALPS_POT_NARROW]
R44  10kB  POT_US_SHIELDEDVERTICAL_PS  [ALPS_POT_VERTICAL_PS]
R45  10kB  POT_US_SHIELDEDVERTICAL_PS  [ALPS_POT_VERTICAL_PS]
R46  10kB  POT_US_SHIELDEDVERTICAL_NARROW  [ALPS_POT_NARROW]
R62  10kB  POT_US_SHIELDEDVERTICAL_NARROW  [ALPS_POT_NARROW]
R63  10kB  POT_US_SHIELDEDVERTICAL_NARROW  [ALPS_POT_NARROW]
R64  10kB  POT_US_SHIELDEDVERTICAL_NARROW  [ALPS_POT_NARROW]
R65  10kB  POT_US_SHIELDEDVERTICAL_NARROW  [ALPS_POT_NARROW]
R66  10kB  POT_US_SHIELDEDVERTICAL_NARROW  [ALPS_POT_NARROW]

### Nets
+3V3_A: C27.1 IC8.16(VCC) R7.P$1(P:E) R22.P$1(P:E) R23.P$1(P:E) R43.P$1(P:E) R44.P$1(P:E) R45.P$1(P:E) R46.P$1(P:E) R62.P$1(P:E) R63.P$1(P:E) R64.P$1(P:E) R65.P$1(P:E) R66.P$1(P:E) ; also sheet 1,2,3,5,8
DENSITY_POT: C12.1 R7.P$2(P:S) ; also sheet 1
FEEDBACK_POT: C36.1 IC8.13(X0) R43.P$2(P:S)
GND: C12.2 C14.2 C15.2 C25.2 C26.2 C27.2 C33.2 C36.2 C45.2 C46.2 C47.2 C48.2 C52.2 C64.2 IC8.4(X7) IC8.6(INH) IC8.7(VEE) IC8.8(GND) R7.P$3(P:A) R7.P$4(S:GNDL) R7.P$5(S:GNDR) R22.P$3(P:A) R22.P$4(S:GNDL) R22.P$5(S:GNDR) R23.P$3(P:A) R23.P$4(S:GNDL) R23.P$5(S:GNDR) R43.P$3(P:A) R44.P$3(P:A) R44.P$4(S:GNDL) R44.P$5(S:GNDR) R45.P$3(P:A) R45.P$4(S:GNDL) R45.P$5(S:GNDR) R46.P$3(P:A) R62.P$3(P:A) R63.P$3(P:A) R64.P$3(P:A) R65.P$3(P:A) R66.P$3(P:A) ; also sheet 1,2,3,4,5,7,8
PITCH_AMT_POT: C48.1 IC8.2(X6) R66.P$2(P:S)
PITCH_POT: C15.1 R23.P$2(P:S) ; also sheet 1
POSITION_AMT_POT: C45.1 IC8.12(X3) R63.P$2(P:S)
POSITION_POT: C14.1 R22.P$2(P:S) ; also sheet 1
POT_MUX: C64.1 IC8.3(X) ; also sheet 1
POT_MUX_S0: IC8.11(A) ; also sheet 1
POT_MUX_S1: IC8.10(B) ; also sheet 1
POT_MUX_S2: IC8.9(C) ; also sheet 1
REVERB_POT: C52.1 IC8.15(X2) R62.P$2(P:S)
SHAPE_AMT_POT: C47.1 IC8.5(X5) R65.P$2(P:S)
SHAPE_POT: C25.1 R45.P$2(P:S) ; also sheet 1
SIZE_AMT_POT: C46.1 IC8.1(X4) R64.P$2(P:S)
SIZE_POT: C33.1 R44.P$2(P:S) ; also sheet 1
WET_POT: C26.1 IC8.14(X1) R46.P$2(P:S)
Unconnected: R43.P$4(S:GNDR) R43.P$5(S:GNDL) R46.P$4(S:GNDR) R46.P$5(S:GNDL) R62.P$4(S:GNDR) R62.P$5(S:GNDL) R63.P$4(S:GNDR) R63.P$5(S:GNDL) R64.P$4(S:GNDR) R64.P$5(S:GNDL) R65.P$4(S:GNDR) R65.P$5(S:GNDL) R66.P$4(S:GNDR) R66.P$5(S:GNDL)

### Notes on the sheet
- cc-by-sa | UI: Pots
- Fred's Lab
- Émilie Gillet

## Sheet 7 of 8
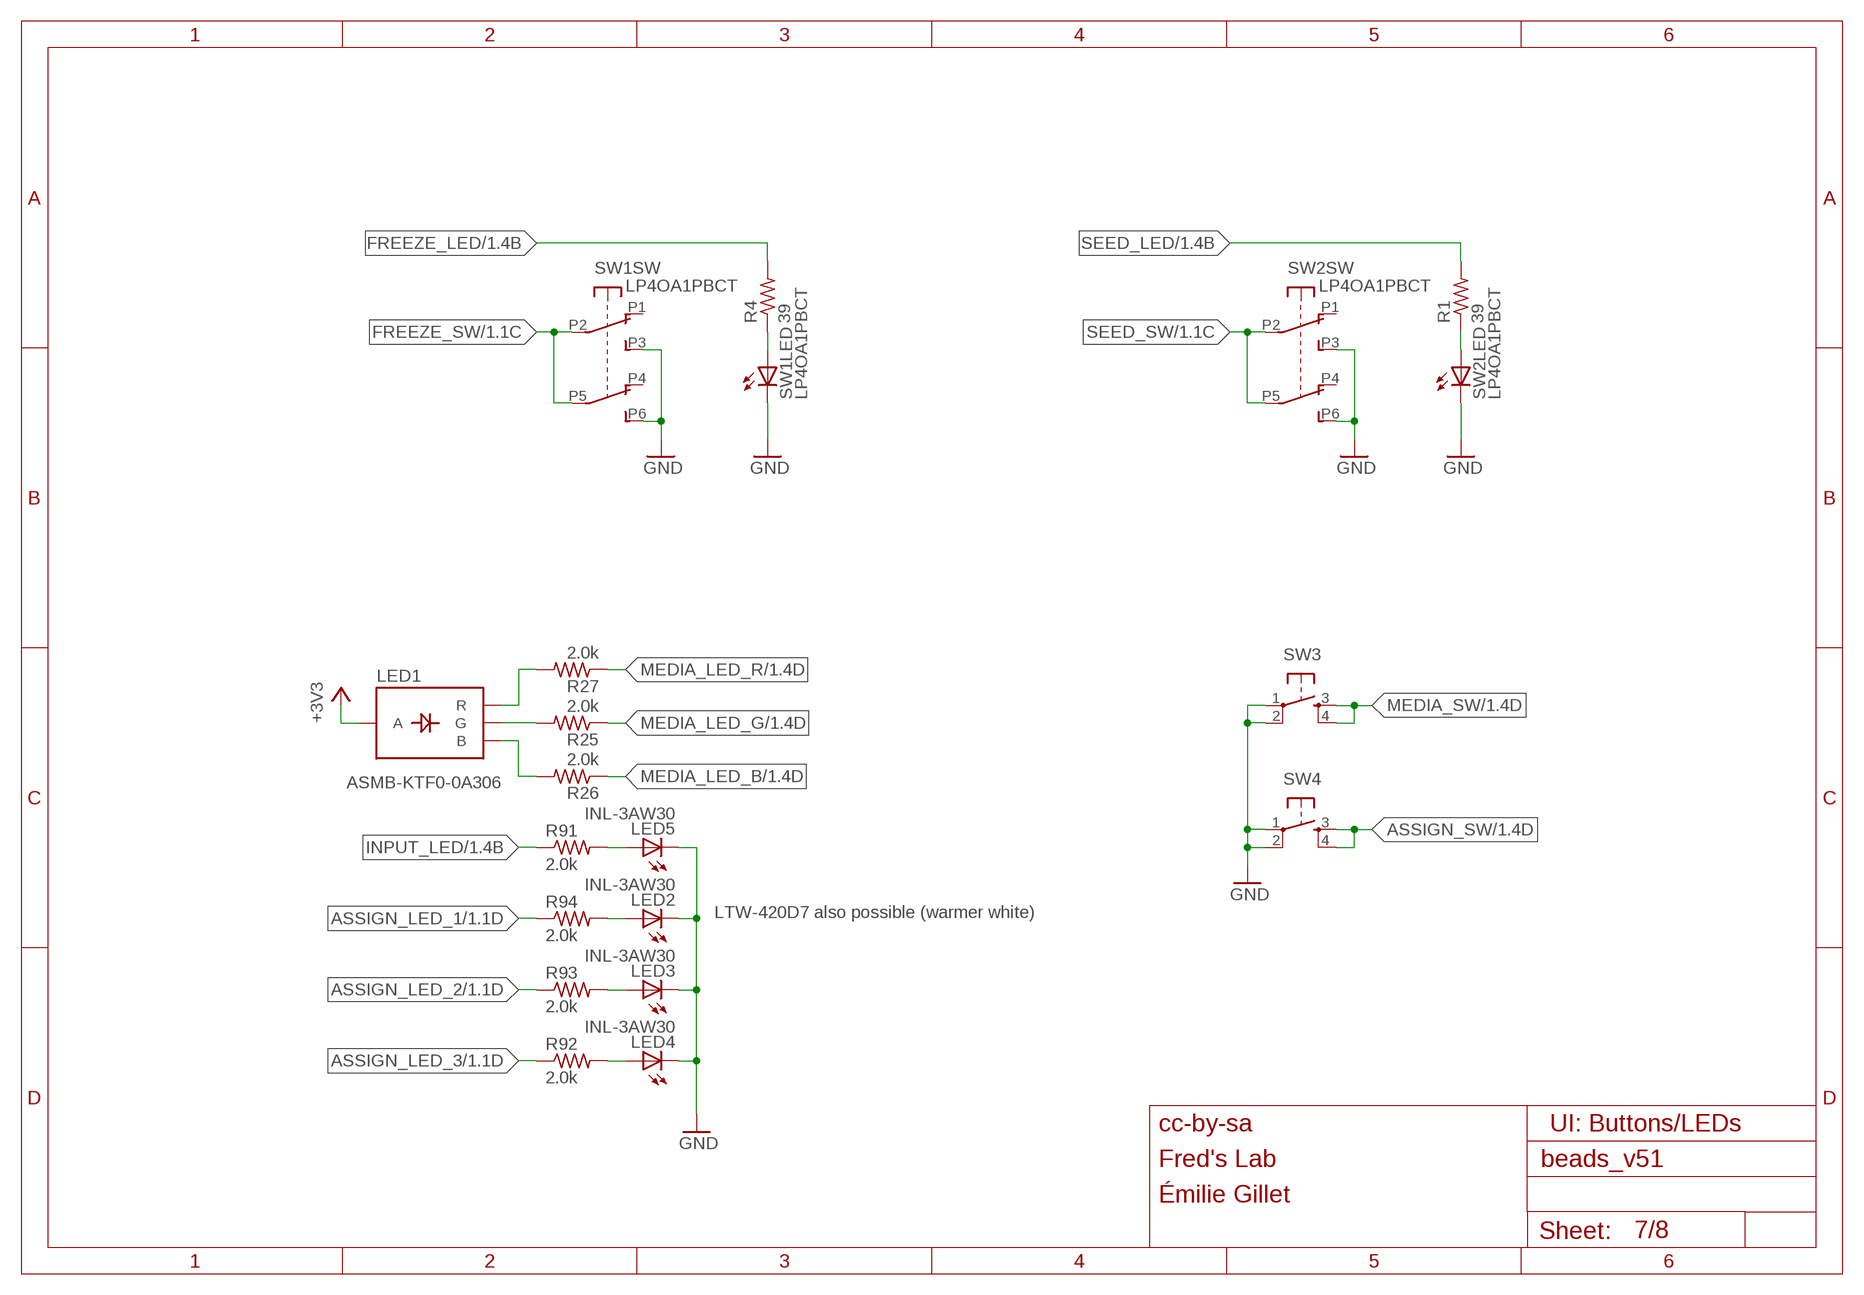
[diagram p6: schematic, sheet 7]

### Parts
LED1  ASMB-KTF0-0A306  ASMB-KTF0-0A306PLCC4  [PLCC-4-2220]
LED2  INL-3AW30  LED3MM  [LED3MM]
LED3  INL-3AW30  LED3MM  [LED3MM]
LED4  INL-3AW30  LED3MM  [LED3MM]
LED5  INL-3AW30  LED3MM  [LED3MM]
R1  39  R-US_R0402  [R0402]
R4  39  R-US_R0402  [R0402]
R25  2.0k  R-US_R0402  [R0402]
R26  2.0k  R-US_R0402  [R0402]
R27  2.0k  R-US_R0402  [R0402]
R91  2.0k  R-US_R0402  [R0402]
R92  2.0k  R-US_R0402  [R0402]
R93  2.0k  R-US_R0402  [R0402]
R94  2.0k  R-US_R0402  [R0402]
SW1  LP4OA1PBCT  [LP4OA1PBCT]
SW2  LP4OA1PBCT  [LP4OA1PBCT]
SW3  TAC_SWITCHSMD_JLEAD  [TACTILE_SWITCH_SMD_JLEAD]
SW4  TAC_SWITCHSMD_JLEAD  [TACTILE_SWITCH_SMD_JLEAD]

### Nets
+3V3: LED1.1(A) ; also sheet 1,2,8
ASSIGN_LED_1: R94.1 ; also sheet 1
ASSIGN_LED_2: R93.1 ; also sheet 1
ASSIGN_LED_3: R92.1 ; also sheet 1
ASSIGN_SW: SW4.3 SW4.4 ; also sheet 1
FREEZE_LED: R4.2 ; also sheet 1
FREEZE_SW: SW1.P2(SW:A2) SW1.P5(SW:B2) ; also sheet 1
GND: LED2.K(C) LED3.K(C) LED4.K(C) LED5.K(C) SW1.L2(LED:L2) SW1.P3(SW:A3) SW1.P6(SW:B3) SW2.L2(LED:L2) SW2.P3(SW:A3) SW2.P6(SW:B3) SW3.1 SW3.2 SW4.1 SW4.2 ; also sheet 1,2,3,4,5,6,8
INPUT_LED: R91.1 ; also sheet 1
MEDIA_LED_B: R26.1 ; also sheet 1
MEDIA_LED_G: R25.1 ; also sheet 1
MEDIA_LED_R: R27.1 ; also sheet 1
MEDIA_SW: SW3.3 SW3.4 ; also sheet 1
N$12: R1.1 SW2.L1(LED:L1)
N$34: LED4.A R92.2
N$48: LED1.2(R) R27.2
N$70: R4.1 SW1.L1(LED:L1)
N$71: LED5.A R91.2
N$75: LED1.3(G) R25.2
N$76: LED1.4(B) R26.2
N$77: LED2.A R94.2
N$78: LED3.A R93.2
SEED_LED: R1.2 ; also sheet 1
SEED_SW: SW2.P2(SW:A2) SW2.P5(SW:B2) ; also sheet 1
Unconnected: SW1.P1(SW:A1) SW1.P4(SW:B1) SW2.P1(SW:A1) SW2.P4(SW:B1)

### Notes on the sheet
- LTW-420D7 also possible (warmer white)
- cc-by-sa | UI: Buttons/LEDs
- Fred's Lab
- Émilie Gillet

## Sheet 8 of 8
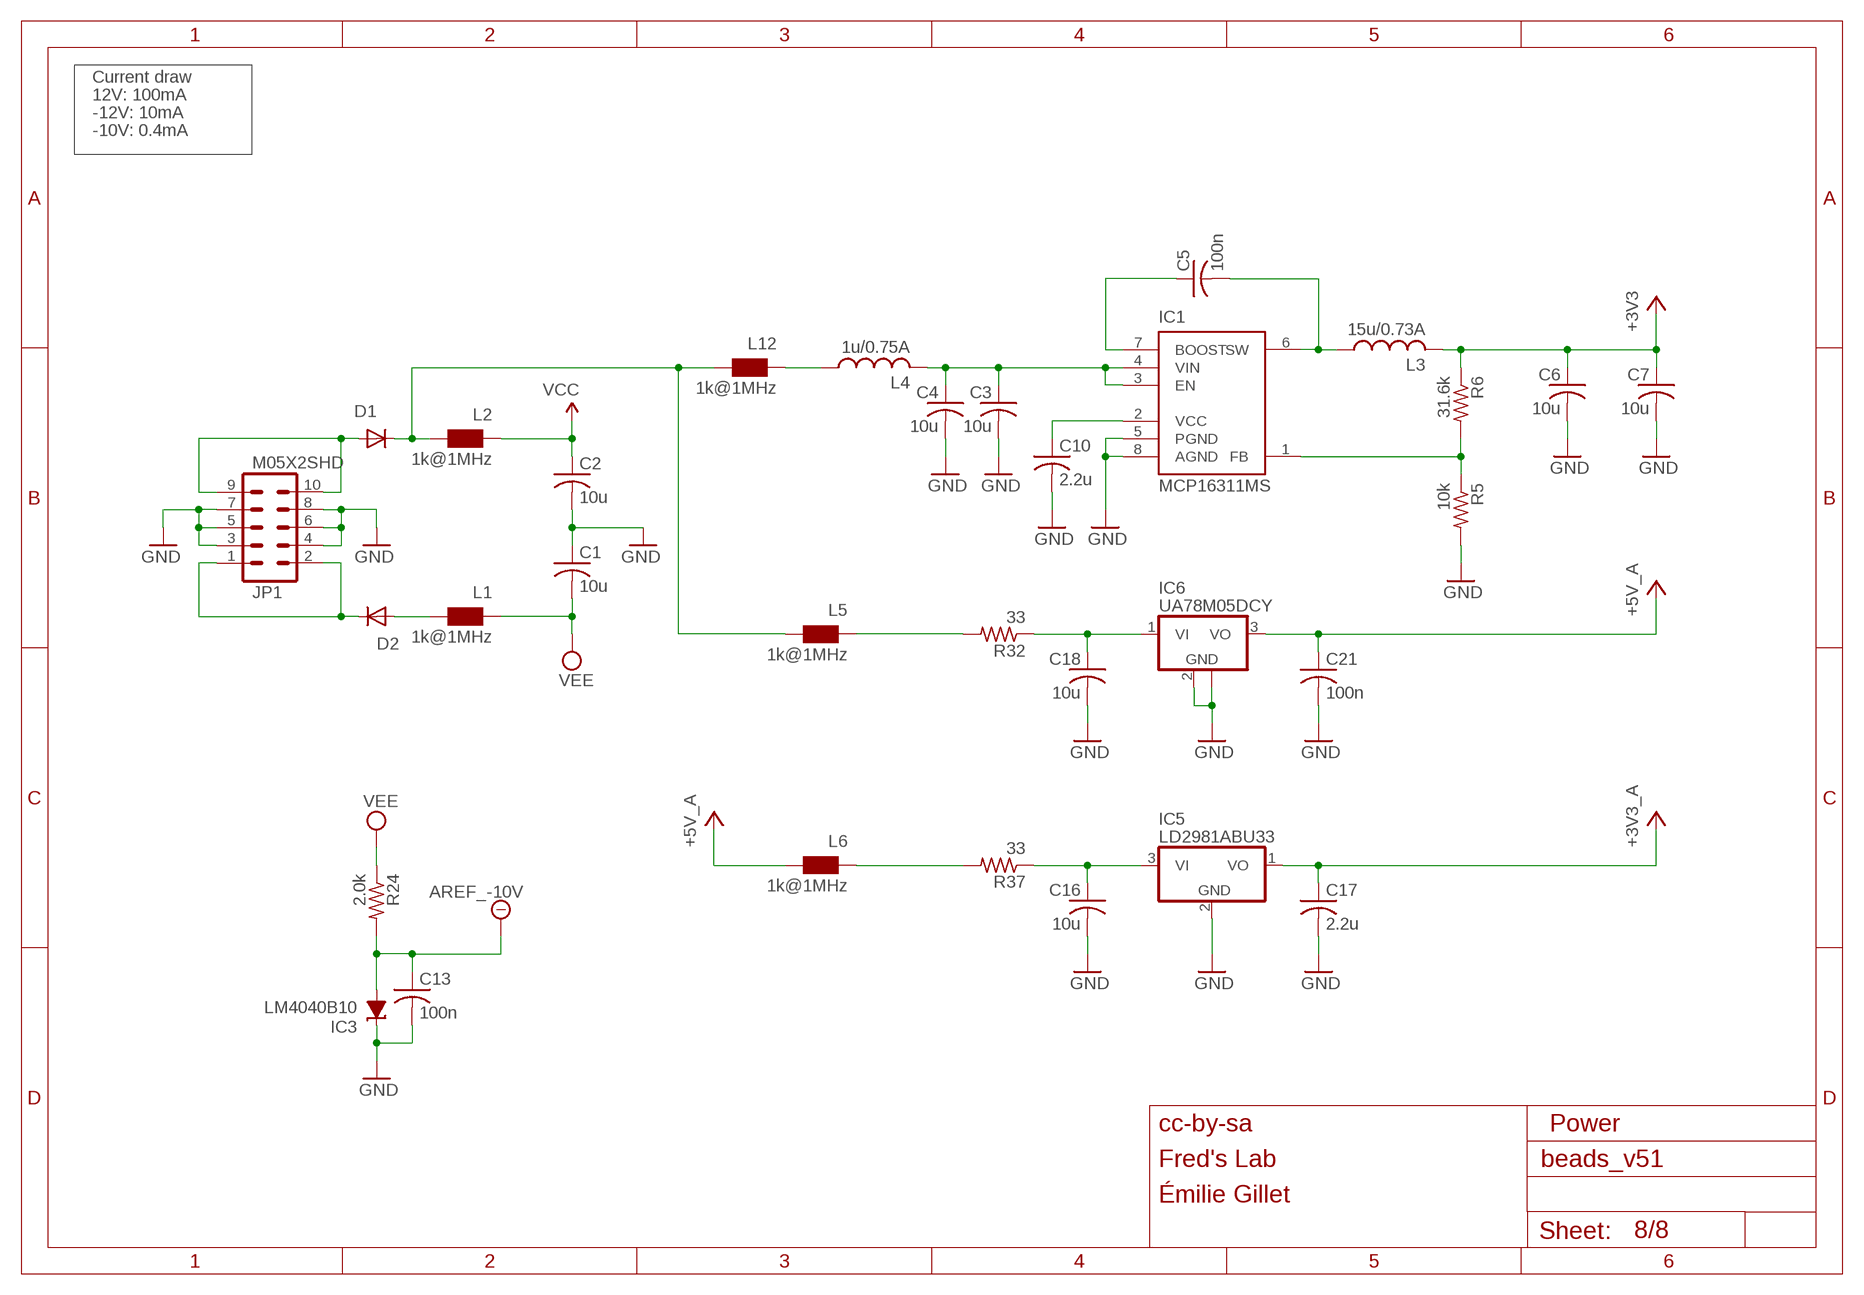
[diagram p7: schematic, sheet 8]

### Parts
C1  10u  C-USC0805  [C0805]
C2  10u  C-USC0805  [C0805]
C3  10u  C-USC0603  [C0603]
C4  10u  C-USC0603  [C0603]
C5  100n  C-USC0402  [C0402]
C6  10u  C-USC0603  [C0603]
C7  10u  C-USC0603  [C0603]
C10  2.2u  C-USC0402  [C0402]
C13  100n  C-USC0402  [C0402]
C16  10u  C-USC0603  [C0603]
C17  2.2u  C-USC0402  [C0402]
C18  10u  C-USC0603  [C0603]
C21  100n  C-USC0402  [C0402]
D1  1N5819HW  DIODE-SOD123  [SOD123]
D2  1N5819HW  DIODE-SOD123  [SOD123]
IC1  MCP16311MS  [MSOP-8]
IC3  LM4040B10  LM4041B12DBZ  [DBZ_R-PDSO-G3]
IC5  LD2981ABU33  LD2981ABU  [SOT89]
IC6  UA78M05DCY  [SOT223]
JP1  M05X2SHD  [2X5-SHROUDED]
L1  1k@1MHz  WE-CBF_0603  [0603]
L2  1k@1MHz  WE-CBF_0603  [0603]
L3  15u/0.73A  L-US1210  [R1210]
L4  1u/0.75A  L-US1210  [R1210]
L5  1k@1MHz  WE-CBF_0603  [0603]
L6  1k@1MHz  WE-CBF_0603  [0603]
L12  1k@1MHz  WE-CBF_0603  [0603]
R5  10k  R-US_R0402  [R0402]
R6  31.6k  R-US_R0402  [R0402]
R24  2.0k  R-US_R0402  [R0402]
R32  33  R-US_R1206  [R1206]
R37  33  R-US_R1206  [R1206]

### Nets
+3V3: C6.1 C7.1 L3.2 R6.1 ; also sheet 1,2,7
+3V3_A: C17.1 IC5.1(VO) ; also sheet 1,2,3,5,6
+5V_A: C21.1 IC6.3(VO) L6.2 ; also sheet 5
-10V: C13.1 IC3.2(A) R24.2 ; supply symbol labelled AREF_-10V ; also sheet 2
GND: C1.1 C2.2 C3.2 C4.2 C6.2 C7.2 C10.2 C13.2 C16.2 C17.2 C18.2 C21.2 IC1.5(PGND) IC1.8(AGND) IC3.1(C) IC5.2(GND) IC6.2(GND) IC6.4(GND) JP1.3 JP1.4 JP1.5 JP1.6 JP1.7 JP1.8 R5.2 ; also sheet 1,2,3,4,5,6,7
N$1: C3.1 C4.1 IC1.3(EN) IC1.4(VIN) L4.2
N$31: C16.1 IC5.3(VI) R37.1
N$38: D2.A L1.2
N$40: D1.C L2.2 L5.2 L12.2
N$42: C18.1 IC6.1(VI) R32.1
N$50: L6.1 R37.2
N$56: D2.C JP1.1 JP1.2
N$57: L4.1 L12.1
N$64: L5.1 R32.2
N$79: D1.A JP1.9 JP1.10
N$80: C10.1 IC1.2(VCC)
N$81: C5.2 IC1.6(SW) L3.1
N$83: C5.1 IC1.7(BOOST)
N$84: IC1.1(FB) R5.1 R6.2
VCC: C2.1 L2.1 ; also sheet 4,5
VEE: C1.2 L1.1 R24.1 ; also sheet 4,5

### Notes on the sheet
- Current draw
- 12V: 100mA
- -12V: 10mA
- -10V: 0.4mA
- cc-by-sa | Power
- Fred's Lab
- Émilie Gillet

## Library data of the parts
C1-C4 C6 C7 C16 C18 C28 C29 C34 C35 C54 C55 C59 = rcl:C-US: CAPACITOR, American symbol; SPICEPREFIX: C
C5 C8-C15 C17 C19-C27 C30-C33 C36-C53 C56-C58 C60-C72 = rcl-0402-tweaked:C-US: CAPACITOR, American symbol
D1 D2 = diode:DIODE-: DIODE
D3 = diode:DIODE_2CACA-: 2 Diodes - Cathode-Anode|Cathode-Anode
D4-D15 = og-diodes:TVS
IC1 = og-vreg:MCP16311
IC2 IC4 = og-linear:TL074: OP AMP
IC3 = texas:LM4041: PRECISION MICROPOWER SHUNT VOLTAGE REFERENCE Source: http://focus.ti.com/lit/ds/slcs146e/slcs146e.pdf; MPN: LM4041B12IDBZR; OC_FARNELL: 1575212; OC_NEWARK: 58K5882
IC5 = og-vreg:LD2981
IC6 = linear:UA78M*: POSITIVE-VOLTAGE REGULATORS Source: http://focus.ti.com/lit/ds/symlink/ua78m33.pdf
IC7 = fredslab:PCM3060: 24-Bit, 96/192-kHz Asynchronous stereo audio codec
IC8 = og-ics:4051: 8-channel ANALOG MULTIPLEXER
IC9 IC10 = og-linear:TL072: OP AMP
IC11 = og-stm32f2:STM32H74X
J1-J12 = og-pj301:PJ301_THONKICONN
JP1 = og-header:M05X2: Header 5x2 Standard 10-pin dual row 0.1" header. Commonly used with AVR-ISP. Use with Spark Fun Electronics SKU: PRT-00778
JP2 = SparkFun:M04: Header 4 Standard 4-pin 0.1" header. Use with straight break away headers (SKU : PRT-00116), right angle break away headers (PRT-00553), swiss pins (PRT-00743), machine pins (PRT-00117), and female headers (PRT-00115). Molex polarized connector foot print use with SKU : PRT-08231 with associated crimp pins and housings.
JP3 = SparkFun:M02: Header 2 Standard 2-pin 0.1" header. Use with straight break away headers (SKU : PRT-00116), right angle break away headers (PRT-00553), swiss pins (PRT-00743), machine pins (PRT-00117), and female headers (PRT-00115). Molex polarized connector foot print use with SKU : PRT-08233 with associated crimp pins and housings.
L1 L2 L5-L7 L11 L12 = wuerth-elektronik:WE-CBF: SMD EMI Suppression Ferrite Beads - excellent anti-EMI properties - low DCR - impedances till 3000 ohms - rated current up to 6 A
L3 L4 = og-rcl:L-US
LED1 = og-leds:ASMB-KTF0-0A306: Broadcom ASMB-KTF0-0A306 Compact RGB LED with common anode.
LED2-LED5 = led:LED: LED OSRAM: - CHIPLED LG R971, LG N971, LY N971, LG Q971, LY Q971, LO R971, LY R971 LH N974, LH R974 LS Q976, LO Q976, LY Q976 LO Q996 - Hyper CHIPLED LW Q18S LB Q993, LB Q99A, LB R99A - SideLED LS A670, LO A670, LY A670, LG A670, LP A670 LB A673, LV A673, LT A673, LW A673 LH A674 LY A675 LS A676, LA A676, LO A676, LY A676, LW A676 LS A679, LY A679, LG A679 - Hyper Micro SIDELED® LS Y876, LA Y876, LO Y876, LY Y876 LT Y87S - SmartLED LW L88C, LW L88S LB L89C, LB L89S, LG L890 LS L89K, LO L89K, LY L89K LS L896, LA L896, LO L896, LY L896 - TOPLED LS T670, LO T670, LY T670, LG T670, LP T670 LSG T670, LSP T670, LSY T670, LOP T670, LYG T670 LG T671, LOG T671, LSG T671 LB T673, LV T673, LT T673, LW T673 LH T674 LS T676, LA T676, LO T676, LY T676, LB T676, LH T676, LSB T676, LW T676 LB T67C, LV T67C, LT T67C, LS T67K, LO T67K, LY T67K, LW E67C LS E67B, LA E67B, LO E67B, LY E67B, LB E67C, LV E67C, LT E67C LW T67C LS T679, LY T679, LG T679 LS T770, LO T770, LY T770, LG T770, LP T770 LB T773, LV T773, LT T773, LW T773 LH T774 LS E675, LA E675, LY E675, LS T675 LS T776, LA T776, LO T776, LY T776, LB T776 LHGB T686 LT T68C, LB T68C - Hyper Mini TOPLED® LB M676 - Mini TOPLED Santana® LG M470 LS M47K, LO M47K, LY M47K Source: http://www.osram.convergy.de LUXEON: - LUMILED® LXK2-PW12-R00, LXK2-PW12-S00, LXK2-PW14-U00, LXK2-PW14-V00 LXK2-PM12-R00, LXK2-PM12-S00, LXK2-PM14-U00 LXK2-PE12-Q00, LXK2-PE12-R00, LXK2-PE12-S00, LXK2-PE14-T00, LXK2-PE14-U00 LXK2-PB12-K00, LXK2-PB12-L00, LXK2-PB12-M00, LXK2-PB14-N00, LXK2-PB14-P00, LXK2-PB14-Q00 LXK2-PR12-L00, LXK2-PR12-M00, LXK2-PR14-Q00, LXK2-PR14-R00 LXK2-PD12-Q00, LXK2-PD12-R00, LXK2-PD12-S00 LXK2-PH12-R00, LXK2-PH12-S00 LXK2-PL12-P00, LXK2-PL12-Q00, LXK2-PL12-R00 Source: www.luxeon.com KINGBRIGHT: KA-3528ASYC Source: www.kingbright.com
Q1 = og-crystal:CRYSTAL: Crystal with 2 extra terminals for the metal LID (Abracon ABMM2 for example)
R1-R6 R8-R21 R24-R31 R33-R36 R38-R42 R47-R61 R67-R75 R78-R95 = rcl-0402-tweaked:R-US_: RESISTOR, American symbol
R7 R22 R23 R43-R46 R62-R66 = og-pots:POT_US_SHIELDED
R32 R37 R76 R77 = rcl:R-US_: RESISTOR, American symbol; SPICEPREFIX: R
SW1 SW2 = og-switch:LP4OA1PBCT
SW3 SW4 = og-switch:TAC_SWITCH: Momentary Switch E-switch TL1105SPF250Q (PTH) or TL3301SPF260QG (SMT)